# Altium schematic sheet IndicatorLEDs.SchDoc
size A4; DocumentNumber: 4; SheetNumber: 4; SheetTotal: 12
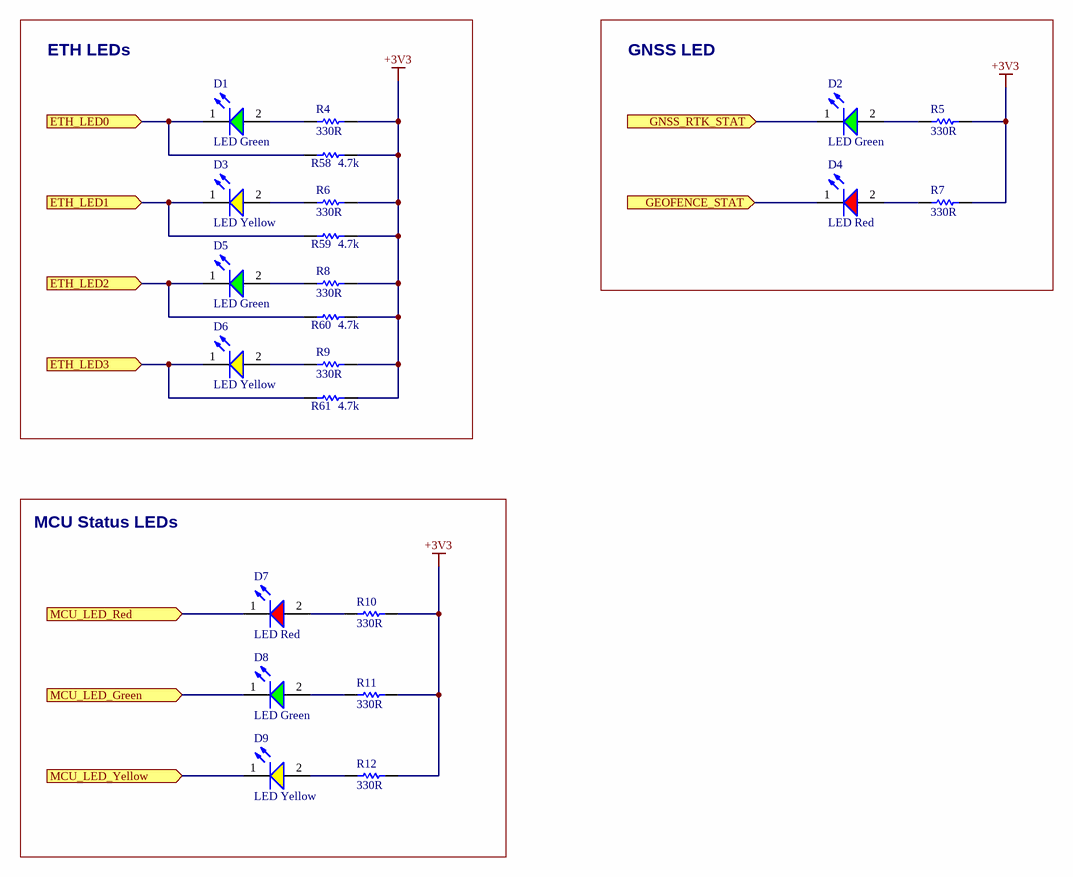
[diagram p0: IndicatorLEDs.SchDoc]

## Parts
D1  LED Green  [WL-SMCW_0603_150060xx75000]
D2  LED Green  [WL-SMCW_0603_150060xx75000]
D3  LED Yellow  [WL-SMCW_0603_150060xx75000]
D4  LED Red  [WL-SMCW_0603_150060xx75000]
D5  LED Green  [WL-SMCW_0603_150060xx75000]
D6  LED Yellow  [WL-SMCW_0603_150060xx75000]
D7  LED Red  [WL-SMCW_0603_150060xx75000]
D8  LED Green  [WL-SMCW_0603_150060xx75000]
D9  LED Yellow  [WL-SMCW_0603_150060xx75000]
R4  330R  [RESC0402(1005)_M]
R5  330R  [RESC0402(1005)_M]
R6  330R  [RESC0402(1005)_M]
R7  330R  [RESC0402(1005)_M]
R8  330R  [RESC0402(1005)_M]
R9  330R  [RESC0402(1005)_M]
R10  330R  [RESC0402(1005)_M]
R11  330R  [RESC0402(1005)_M]
R12  330R  [RESC0402(1005)_M]
R58  4.7k  [RESC1005X40X25LL05T05]
R59  4.7k  [RESC1005X40X25LL05T05]
R60  4.7k  [RESC1005X40X25LL05T05]
R61  4.7k  [RESC1005X40X25LL05T05]

## Blocks framed on the sheet
ETH LEDs: D1 D3 D5 D6 R4 R6 R8 R9 R58-R61
GNSS LED: D2 D4 R5 R7
MCU Status LEDs: D7-D9 R10-R12

## Ports
ETH_LED0 (in, see MAIN[3C], ETH[4C]), ETH_LED1 (in, see MAIN[3C], ETH[4C]), ETH_LED2 (in, see MAIN[3C], ETH[4C]), ETH_LED3 (in, see MAIN[3C], ETH[4C]), GEOFENCE_STAT (in, see MAIN[3D], GNSS_ZED-X20P[2B], MCU[1B]), GNSS_RTK_STAT (in, see MAIN[3D], GNSS_ZED-X20P[2B], MCU[1B]), MCU_LED_Green (in, see MAIN[3D], MCU[2C]), MCU_LED_Red (in, see MAIN[3D], MCU[2C]), MCU_LED_Yellow (in, see MAIN[3D], MCU[2D])

## Nets
+3V3: R4.2 R5.2 R6.2 R7.2 R8.2 R9.2 R10.2 R11.2 R12.2 R58.2 R59.2 R60.2 R61.2
ETH_LED0: D1.1(K) R58.1 ; port ETH_LED0
ETH_LED1: D3.1(K) R59.1 ; port ETH_LED1
ETH_LED2: D5.1(K) R60.1 ; port ETH_LED2
ETH_LED3: D6.1(K) R61.1 ; port ETH_LED3
GEOFENCE_STAT: D4.1(K) ; port GEOFENCE_STAT
GNSS_RTK_STAT: D2.1(K) ; port GNSS_RTK_STAT
MCU_LED_Green: D8.1(K) ; port MCU_LED_Green
MCU_LED_Red: D7.1(K) ; port MCU_LED_Red
MCU_LED_Yellow: D9.1(K) ; port MCU_LED_Yellow
NetD1_2: D1.2(A) R4.1
NetD2_2: D2.2(A) R5.1
NetD3_2: D3.2(A) R6.1
NetD4_2: D4.2(A) R7.1
NetD5_2: D5.2(A) R8.1
NetD6_2: D6.2(A) R9.1
NetD7_2: D7.2(A) R10.1
NetD8_2: D8.2(A) R11.1
NetD9_2: D9.2(A) R12.1

## Notes on the sheet
- Project:
- Drawing number:
- Date:
- 1
- Rev:
- Format:
- A4
- Laboratory:
- Drawn by:
- Sheet:
- Page:
- of
- File:

## Library data of the parts
D1 D2 D5 D8 = CMP-1426-00006-7: WURTH ELEKTRONIK - 150060VS75000 - LED, Green, SMD, 0603, 30 mA, 2 V, 570 nm; Reverse Voltage: 5V; Power Dissipation: 72mW; Dominant Wavelength: 570nm; Peak Wavelength: 572nm; Forward Current: 100mA; Forward Voltage: 2V; Lens Style: Clear, Rectangular; Test Current: 20mA; Max Junction Temperature (Tj): 95°C; Viewing Angle: 140°; Luminous Intensity: 40mcd; Height: 700µm; Width: 800µm; Length: 1.6mm; Mount: Surface Mount; Min Operating Temperature: -40°C; Max Reverse Voltage (DC): 5V; Case Code (Imperial): 0603; Wavelength: 570nm; Color: Green; REACH SVHC: Unknown; RoHS: Compliant; Max Operating Temperature: 85°C; Packaging: Tape and Reel; Case/Package: 0603; Number of Pins: 2; Case Code (Metric): 1608; Supplier: RS; Supplier Part Number: 8154215P
D3 D6 D9 = CMP-1426-00005-3: WL-SMCW SMT Mono-Color Chip LED Waterclear; Power Dissipation: 72mW; Reverse Voltage: 5V; Forward Voltage: 2V; Test Current: 20mA; Luminous Intensity: 120mcd; Max Junction Temperature (Tj): 95°C; Wavelength: 590nm; Forward Current: 100mA; Lens Style: Clear, Rectangular; Viewing Angle: 140°; Peak Wavelength: 595nm; Case Code (Metric): 1608; Length: 1.6mm; Max Reverse Voltage (DC): 5V; Case Code (Imperial): 0603; Dominant Wavelength: 590nm; Color: Yellow; Mount: Surface Mount; Max Operating Temperature: 85°C; Min Operating Temperature: -40°C; Packaging: Tape and Reel; REACH SVHC: Unknown; Width: 800µm; Case/Package: 0603; Height: 700µm; RoHS: Compliant; Supplier: Farnell; Supplier Part Number: 150060YS75000
D4 D7 = CMP-1426-00001-4: LED Low-Power Uni-Color Red 630nm 2V 2-Pin Chip 0603(1608Metric) T/R; Max Junction Temperature (Tj): 95°C; Dominant Wavelength: 625nm; Lens Style: Clear, Rectangular; Viewing Angle: 140°; Forward Current: 100mA; Max Reverse Voltage (DC): 5V; Luminous Intensity: 250mcd; Test Current: 20mA; Power Dissipation: 72mW; Max Operating Temperature: 85°C; Mount: Surface Mount; Height: 700µm; Packaging: Tape and Reel; REACH SVHC: Unknown; Case Code (Metric): 1608; Peak Wavelength: 630nm; Forward Voltage: 2V; Case/Package: 0603; Color: Red; RoHS: Compliant; Width: 800µm; Reverse Voltage: 5V; Min Operating Temperature: -40°C; Wavelength: 625nm; Case Code (Imperial): 0603; Length: 1.6mm; Supplier: Farnell; Supplier Part Number: 150060RS75000
R4-R12 = CMP-1011-00062-1: 330R 0.063W 5% 0402 (1005 Metric)  SMD; Case-EIA: 0402; Value: 330.00 Ohm; Case-Metric: 1005; Tolerance: 5 %; Technology: SMT; Power: 0.063 W; Supplier: DigiKey; Supplier Part Number: CRCW0402330RJNTD-ND
R58-R61 = CMP-1011-00090-2: Part Number: CRCW04024K70JNTD; Manufacturer: Vishay Dale